# EasyEDA Pro project climbsnail-spotwelder-45c7d2f7.epro, board MiniMos板切分
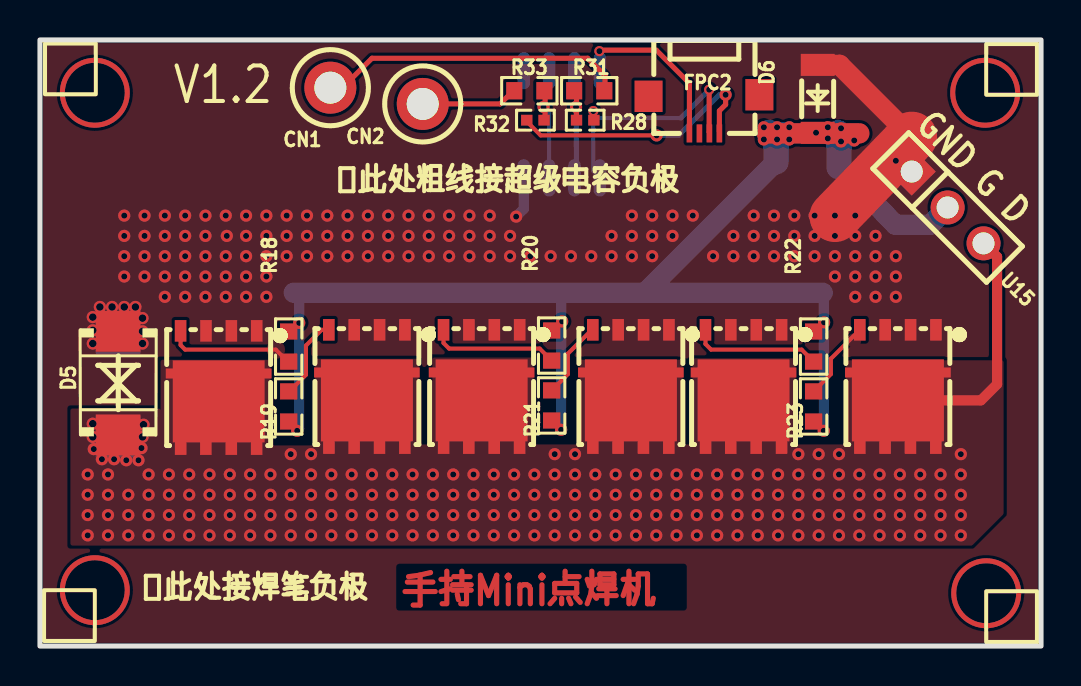
[diagram p6: board, top side]
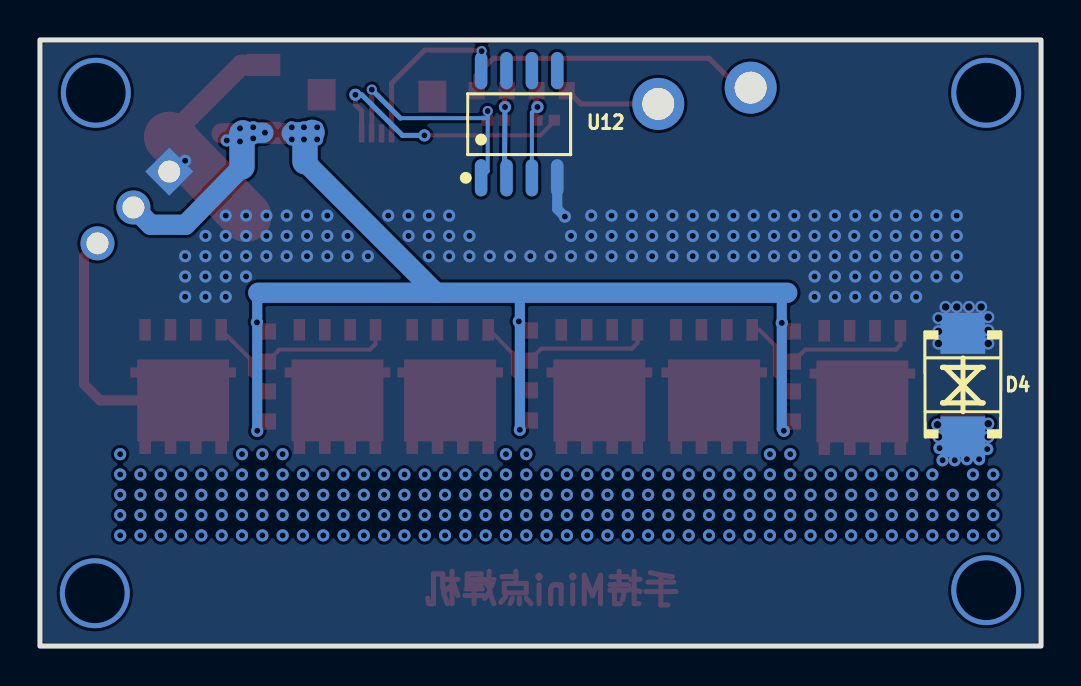
[diagram p7: board, bottom side, seen from below]

Outline 50.09 x 30.33 mm; copper layers: Top Layer, Bottom Layer. Coordinates in mm from the lower left corner of the outline.
Outline path: rectangle 0,30.33 50.09,0
Stack: Top Layer 0.035mm / Dielectric1 1.51mm FR4 er 4.5 / Bottom Layer 0.035mm

## Design rules (mm)
spacing safeClearance (default): track to track 0.152, other pairs 0.152 to 0.3
spacing Plane_innerPlane: track to track 0.152, other pairs 0.152 to 0.3
spacing Copper_copperRegion: track to track 0.152, other pairs 0.152 to 0.3
track width trackWidth (default): min 0.127, default 0.254, max 2.54
differential pair differentialPair (default): width min 0.127, default 0.254, max 2.54; gap min 0.152, default 0.152
pour e397 uses Copper_copperRegion
pour e399 uses Copper_copperRegion
pour e401 uses Copper_copperRegion
pour e403 uses Copper_copperRegion

## Placement (name value [footprint] x y rotation side)
CN1  -  [TH_BD3.2-D2.0]  14.53 27.94 0 top
CN2  -  [TH_BD3.2-D2.0]  19.15 27.13 0 top
D4  -  [SMB_L4.6-W3.6-LS5.3-BI]  3.91 13.06 90 bottom
D5  -  [SMB_L4.6-W3.6-LS5.3-BI]  3.91 13.16 90 top
D6  -  [LL-34_L3.5-W1.5-RD]  38.91 27.38 90 top
FPC2  -  [FPC-SMD_4P-P0.50_XKB_X05A12H04G]  33.22 26.62 180 top
R18  -  [R0603]  12.45 14.99 270 top
R19  -  [R0603]  12.45 11.99 90 top
R20  -  [R0603]  25.6 15.04 270 top
R21  -  [R0603]  25.6 12.04 90 top
R22  -  [R0603]  38.71 14.99 270 top
R23  -  [R0603]  38.71 11.99 90 top
R28  -  [R0402]  27.28 26.31 180 top
R31  -  [R0603]  27.48 27.79 0 top
R32  -  [R0402]  24.79 26.31 180 top
R33  -  [R0603]  24.49 27.79 0 top
U4  -  [DFN-8_L5.8-W5.1-P1.27-LS5.9-BL]  8.94 12.94 180 top
U5  -  [DFN-8_L5.8-W5.1-P1.27-LS5.9-BL]  16.36 12.99 180 top
U6  -  [DFN-8_L5.8-W5.1-P1.27-LS5.9-BL]  22.1 12.99 180 top
U7  -  [DFN-8_L5.8-W5.1-P1.27-LS5.9-BL]  29.57 12.99 180 top
U8  -  [DFN-8_L5.8-W5.1-P1.27-LS5.9-BL]  35.2 12.99 180 top
U9  -  [DFN-8_L5.8-W5.1-P1.27-LS5.9-BL]  42.93 12.99 180 top
U12  -  [SOP-8_L4.9-W3.9-P1.27-LS6.0-BL]  26.11 26.11 180 bottom
U15  -  [HDR-TH_3P-P2.54-V-M]  45.42 21.95 315 top

## Footprints (pads in the part's own frame, mm; a bottom-side part is the same pattern mirrored in y, then rotated)
DFN-8_L5.8-W5.1-P1.27-LS5.9-BL
  rect 0.58x1.079 smd: 1(-1.905,-2.834) 2(-0.635,-2.834) 3(0.635,-2.834) 4(1.905,-2.834)
  rect 0.58x1.08 smd: 5(1.9,2.834) 6(0.64,2.834) 7(-0.63,2.834) 8(-1.9,2.834)
  rect 0.95x0.5 smd: 9(-2.169,-0.7) 9(2.169,-0.7)
  rect 4.6x4.1 smd: 9(0,0.695)
FPC-SMD_4P-P0.50_XKB_X05A12H04G
  rect 0.28x0.9 smd: 1(-0.772,0.968) 2(-0.272,0.968) 3(0.228,0.968) 4(0.728,0.968)
  rect 1.4x1.57 smd: 5(-2.772,-0.968) 6(2.772,-0.889)
HDR-TH_3P-P2.54-V-M
  rect 1.7x1.7 hole 1.1: 1(-2.54,0)
  round 1.7 hole 1.1: 2(0,0) 3(2.54,0)
LL-34_L3.5-W1.5-RD
  rect 1.1x1.7 smd: 1(-1.7,0) 2(1.7,0)
R0402
  rect 0.566x0.54 smd: 1(-0.433,0) 2(0.433,0)
R0603
  rect 0.806x0.864 smd: 1(-0.753,0) 2(0.753,0)
SMB_L4.6-W3.6-LS5.3-BI
  rect 2.047x2.241 smd: 1(-2.591,0) 2(2.591,0)
SOP-8_L4.9-W3.9-P1.27-LS6.0-BL
  oval 0.63x1.865 smd: 1(-1.905,-2.683) 2(-0.635,-2.683) 3(0.635,-2.683) 4(1.905,-2.683) 5(1.905,2.683) 6(0.635,2.683) 7(-0.635,2.683) 8(-1.905,2.683)
TH_BD3.2-D2.0
  round 2.6 hole 1.6: 1(0,0)

## Nets
AGND: FPC2.1 R32.2
GND: D4.2 D5.2 D6.2 U4.1 U4.2 U4.3 U5.1 U5.2 U5.3 U6.1 U6.2 U6.3 U7.1 U7.2 U7.3 U8.1 U8.2 U8.3 U9.1 U9.2 U9.3 U12.4 U15.1
A_3V3: FPC2.4 U12.8
CUR_VOL: FPC2.2 R28.1 U12.1
MOS_D2: D4.1 D5.1 U4.5 U4.6 U4.7 U4.8 U4.9 U5.5 U5.6 U5.7 U5.8 U5.9 U6.5 U6.6 U6.7 U6.8 U6.9 U7.5 U7.6 U7.7 U7.8 U7.9 U8.5 U8.6 U8.7 U8.8 U8.9 U9.5 U9.6 U9.7 U9.8 U9.9 U15.3
MOS_G2: D6.1 R18.1 R19.1 R20.1 R21.1 R22.1 R23.1 U15.2
$1N69310: R18.2 U4.4
$1N69428: R19.2 U5.4
$1N69546: R20.2 U6.4
$1N69664: R21.2 U7.4
$1N69782: R22.2 U8.4
$1N73187: R23.2 U9.4
$1N135994: R32.1 R33.2 U12.3
$1N136281: R28.2 R31.1 U12.2
$1N157330: CN1.1 R31.2
$1N158078: CN2.1 R33.1

Pads without a net: FPC2 3 5 6; U12 5 6 7

## Via types
v1: diameter 3.5, hole 3, Top Layer to Bottom Layer, 4 vias
v2: diameter 0.61, hole 0.305, Top Layer to Bottom Layer, 332 vias
v3: diameter 0.61, hole 0.381, Top Layer to Bottom Layer, 14 vias
v4: diameter 0.508, hole 0.305, Top Layer to Bottom Layer, 3 vias

## Routing (per net, layer and track width the routed paths; a pad name or vN(x,y) marks a point on that pad's centre or on a via; arc(x,y) is an arc through that point)
AGND:
  vias: v2(30.85,25.55) v2(34.31,27.58)
GND:
  vias: v2(4.22,21.54) v2(4.22,20.52) v2(4.22,19.51) v2(4.22,18.49) v2(5.23,21.54) v2(5.23,20.52) v2(5.23,19.51) v2(5.23,18.49) v2(6.25,21.54) v2(6.25,20.52) v2(6.25,19.51) v2(6.25,18.49) v2(6.25,17.47) v2(7.26,21.54) v2(7.26,20.52) v2(7.26,19.51) v2(7.26,18.49) v2(7.26,17.47) v2(8.28,21.54) v2(8.28,20.52) v2(8.28,19.51) v2(8.28,18.49) v2(8.28,17.47) v2(9.3,21.54) v2(9.3,19.51) v2(9.3,18.49) v2(9.3,17.47) v2(9.35,20.52) v2(10.31,21.54) v2(10.31,20.52) v2(10.31,19.51) v2(10.31,18.49) v2(10.31,17.47) v2(11.33,21.54) v2(11.33,20.52) v2(11.33,19.51) v2(11.33,18.49) v2(11.33,17.47) v2(12.34,21.54) v2(12.34,20.52) v2(12.34,19.51) v2(13.36,21.54) v2(13.36,20.52) v2(13.36,19.51) v2(14.38,21.54) v2(14.38,20.52) v2(14.38,19.51) v2(15.39,21.54) v2(15.39,20.52) v2(15.39,19.51) v2(16.41,21.54) v2(16.41,20.52) v2(16.41,19.51) v2(17.42,21.54) v2(17.42,20.52) v2(17.42,19.51) v2(18.44,21.54) v2(18.44,20.52) v2(18.44,19.51) v2(19.46,21.54) v2(19.46,20.52) v2(19.46,19.51) v2(20.47,21.54) v2(20.47,20.52) v2(20.47,19.51) v2(21.49,21.54) v2(21.49,20.52) v2(21.49,19.51) v2(22.5,21.54) v2(22.5,20.52) v2(22.5,19.51) v2(23.52,20.52) v2(23.52,19.51) v2(23.83,21.49) v2(24.54,19.51) v2(25.55,19.51) v2(26.57,19.51) v2(27.58,19.51) v2(28.6,20.52) v2(28.6,19.51) v2(29.62,21.54) v2(29.62,20.52) v2(29.62,19.51) v2(30.63,21.54) v2(30.63,20.52) v2(30.63,19.51) v2(31.65,21.54) v2(31.65,20.52) v2(32.66,21.54) v2(33.68,19.51) v2(34.7,20.52) v2(34.7,19.51) v2(35.71,21.54) v2(35.71,20.52) v2(35.71,19.51) v2(36.73,21.54) v2(36.73,20.52) v2(36.73,19.51) v2(37.74,21.54) v2(37.74,20.52) v2(37.74,19.51) v2(38.76,21.54) v2(38.76,20.52) v2(38.76,19.51) v2(39.78,21.54) v2(39.78,20.52) v2(39.78,19.51) v2(39.78,18.49) v2(40.79,21.54) v2(40.79,20.52) v2(40.79,19.51) v2(40.79,18.49) v2(40.79,17.47) v2(41.81,20.52) v2(41.81,19.51) v2(41.81,18.49) v2(41.81,17.47) v2(42.82,24.28) v2(42.82,19.51) v2(42.82,18.49) v2(42.82,17.47) v3(2.64,16.46) v3(2.64,15.8) v3(2.64,15.14) v3(3,16.97) v3(3.61,16.97) v3(4.22,16.97) v3(4.78,16.97) v3(5.13,16.41) v3(5.13,15.75) v3(5.13,15.14)
(no net):
  vias: v1(2.74,27.69) v1(2.74,2.79) v1(47.3,27.69) v1(47.35,2.64)
A_3V3:
  vias: v4(27.99,29.77)
CUR_VOL:
  vias: v4(27.69,26.77) v4(33.49,27.84)
MOS_D2:
  vias: v2(2.39,8.59) v2(2.39,7.57) v2(2.39,6.55) v2(2.39,5.54) v2(2.69,9.86) v2(3.1,9.35) v2(3.4,8.59) v2(3.4,7.57) v2(3.4,6.55) v2(3.4,5.54) v2(3.71,9.35) v2(4.32,9.3) v2(4.42,7.57) v2(4.42,6.55) v2(4.42,5.54) v2(4.93,9.3) v2(5.08,9.91) v2(5.44,8.59) v2(5.44,7.57) v2(5.44,6.55) v2(5.44,5.54) v2(6.45,8.59) v2(6.45,7.57) v2(6.45,6.55) v2(6.45,5.54) v2(7.47,8.59) v2(7.47,7.57) v2(7.47,6.55) v2(7.47,5.54) v2(8.48,8.59) v2(8.48,7.57) v2(8.48,6.55) v2(8.48,5.54) v2(9.5,8.59) v2(9.5,7.57) v2(9.5,6.55) v2(9.5,5.54) v2(10.52,8.59) v2(10.52,7.57) v2(10.52,6.55) v2(10.52,5.54) v2(11.53,8.59) v2(11.53,7.57) v2(11.53,6.55) v2(11.53,5.54) v2(12.55,9.6) v2(12.55,8.59) v2(12.55,7.57) v2(12.55,6.55) v2(12.55,5.54) v2(13.56,9.6) v2(13.56,8.59) v2(13.56,7.57) v2(13.56,6.55) v2(13.56,5.54) v2(14.58,8.59) v2(14.58,7.57) v2(14.58,6.55) v2(14.58,5.54) v2(15.6,8.59) v2(15.6,7.57) v2(15.6,6.55) v2(15.6,5.54) v2(16.61,8.59) v2(16.61,7.57) v2(16.61,6.55) v2(16.61,5.54) v2(17.63,8.59) v2(17.63,7.57) v2(17.63,6.55) v2(17.63,5.54) v2(18.64,8.59) v2(18.64,7.57) v2(18.64,6.55) v2(18.64,5.54) v2(19.66,8.59) v2(19.66,7.57) v2(19.66,6.55) v2(19.66,5.54) v2(20.68,8.59) v2(20.68,7.57) v2(20.68,6.55) v2(20.68,5.54) v2(21.69,8.59) v2(21.69,7.57) v2(21.69,6.55) v2(21.69,5.54) v2(22.71,8.59) v2(22.71,7.57) v2(22.71,6.55) v2(22.71,5.54) v2(23.72,8.59) v2(23.72,7.57) v2(23.72,6.55) v2(23.72,5.54) v2(24.74,8.59) v2(24.74,7.57) v2(24.74,6.55) v2(24.74,5.54) v2(25.76,9.6) v2(25.76,8.59) v2(25.76,7.57) v2(25.76,6.55) v2(25.76,5.54) v2(26.77,9.6) v2(26.77,8.59) v2(26.77,7.57) v2(26.77,6.55) v2(26.77,5.54) v2(27.79,8.59) v2(27.79,7.57) v2(27.79,6.55) v2(27.79,5.54) v2(28.8,8.59) v2(28.8,7.57) v2(28.8,6.55) v2(28.8,5.54) v2(29.82,8.59) v2(29.82,7.57) v2(29.82,6.55) v2(29.82,5.54) v2(30.84,8.59) v2(30.84,7.57) v2(30.84,6.55) v2(30.84,5.54) v2(31.85,8.59) v2(31.85,7.57) v2(31.85,6.55) v2(31.85,5.54) v2(32.87,8.59) v2(32.87,7.57) v2(32.87,6.55) v2(32.87,5.54) v2(33.88,8.59) v2(33.88,7.57) v2(33.88,6.55) v2(33.88,5.54) v2(34.9,8.59) v2(34.9,7.57) v2(34.9,6.55) v2(34.9,5.54) v2(35.92,8.59) v2(35.92,7.57) v2(35.92,6.55) v2(35.92,5.54) v2(36.93,8.59) v2(36.93,7.57) v2(36.93,6.55) v2(36.93,5.54) v2(37.95,9.6) v2(37.95,8.59) v2(37.95,7.57) v2(37.95,6.55) v2(37.95,5.54) v2(38.96,9.6) v2(38.96,8.59) v2(38.96,7.57) v2(38.96,6.55) v2(38.96,5.54) v2(39.98,9.6) v2(39.98,8.59) v2(39.98,7.57) v2(39.98,6.55) v2(39.98,5.54) v2(41,8.59) v2(41,7.57) v2(41,6.55) v2(41,5.54) v2(42.01,8.59) v2(42.01,7.57) v2(42.01,6.55) v2(42.01,5.54) v2(43.03,8.59) v2(43.03,7.57) v2(43.03,6.55) v2(43.03,5.54) v2(44.04,8.59) v2(44.04,7.57) v2(44.04,6.55) v2(44.04,5.54) v2(45.06,8.59) v2(45.06,7.57) v2(45.06,6.55) v2(45.06,5.54) v2(46.08,9.6) v2(46.08,8.59) v2(46.08,7.57) v2(46.08,6.55) v2(46.08,5.54) v3(2.64,11.12) v3(2.64,10.46) v3(5.13,10.46) v3(5.18,11.07)
MOS_G2: length 0.9
  Top Layer w0.254: v2(39.42,25.4) 39.93,25.91 v2(40.08,25.91)
  vias: v2(12.87,10.77) v2(12.97,16.17) v2(26.13,16.24) v2(26.08,10.82) v2(36.22,25.96) v2(36.22,25.35) v2(36.88,25.96) v2(36.88,25.35) v2(37.49,25.96) v2(37.49,25.35) v2(38.83,25.69) v2(39.24,16.2) v2(39.22,10.77) v2(39.42,25.96) v2(40.08,25.25) v2(40.74,25.3)
$1N135994:
  vias: v2(25.2,26.97)
$1N136281:
  vias: v2(26.82,26.97)

## Copper pours and planes (outline as drawn; the poured copper is in the pictures)
GND on Top Layer: -6.22,51.94 56.97,51.94 56.97,-22.07 -6.22,-22.07
GND on Top Layer: 8.03,16.87 8.03,15.28 11.47,15.28 11.47,16.88 15.13,16.88 15.13,15.31 18.97,15.31 18.97,16.87 21.03,16.87 21.03,15.34 24.7,15.34 24.7,16.85 28.33,16.85 28.35,16.87 28.35,15.34 32.22,15.34 32.22,16.87 34.03,16.87 34.04,16.87 34.04,15.31 37.87,15.31 37.87,16.85 41.72,16.85 41.72,15.3 45.63,15.3 45.63,19.05 42.78,21.9 3.25,21.9 1.83,20.47 1.83,14.72 2.08,14.47 5.54,14.47 5.54,16.87
GND on Bottom Layer: -1.63,51.74 54.71,51.74 54.71,-24.94 -1.63,-24.94
MOS_D2 on Top Layer: 5.99,14.33 11.51,14.33 11.54,14.29 11.54,10.03 13.75,10.03 13.81,10.09 13.76,10.14 13.76,14.37 18.93,14.37 18.96,14.34 18.96,10.08 19.64,10.08 19.64,14.44 24.68,14.44 24.7,14.42 24.7,10.08 27.01,10.08 27.02,10.09 27.02,14.28 26.97,14.33 32.16,14.33 32.16,10.18 32.07,10.08 32.65,10.08 32.65,10.09 32.65,14.34 32.6,14.39 37.76,14.39 37.8,14.44 37.8,10.08 40.33,10.08 40.33,14.3 48.22,14.3 48.22,6.61 46.64,5.03 1.52,5.03 1.52,11.89 5.97,11.89 6.03,11.83 6.03,14.29

## Text on the board
Top Layer: 手持Mini点焊机
Top Solder Mask Layer: 手持Mini点焊机
Top Silkscreen Layer: GND G D | V1.2 | ⬆此处接焊笔负极 | ⬇此处粗线接超级电容负极
